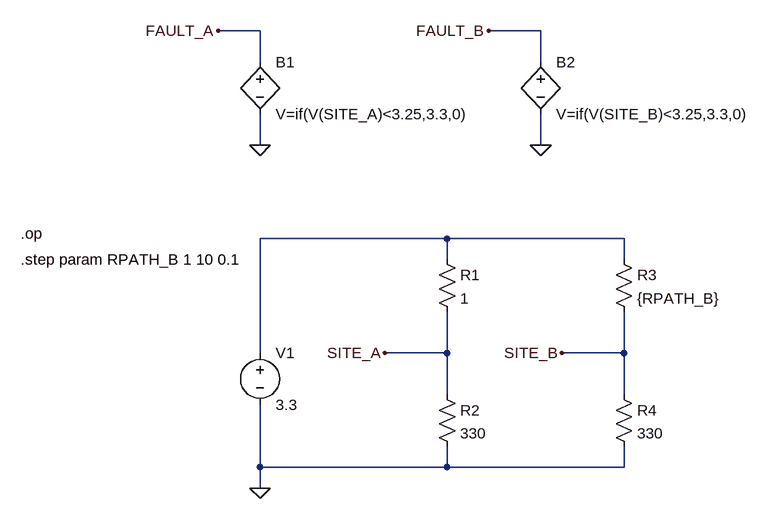
[diagram p0: schematic Mini_LoadBoard_Power_Test.asc]
Mini_LoadBoard_Power_Test.asc, the LTspice schematic file:
Version 4.1
SHEET 1 880 680
WIRE -128 -352 -192 -352
WIRE 304 -352 224 -352
WIRE -128 -304 -128 -352
WIRE 304 -304 304 -352
WIRE -128 -176 -128 -224
WIRE 304 -176 304 -224
WIRE 160 -32 -128 -32
WIRE 432 -32 160 -32
WIRE 160 0 160 -32
WIRE 432 0 432 -32
WIRE -128 144 -128 -32
WIRE 160 144 160 80
WIRE 160 144 64 144
WIRE 432 144 432 80
WIRE 432 144 336 144
WIRE 160 208 160 144
WIRE 432 208 432 144
WIRE -128 320 -128 224
WIRE 160 320 160 288
WIRE 160 320 -128 320
WIRE 432 320 432 288
WIRE 432 320 160 320
WIRE -128 352 -128 320
FLAG -128 352 0
FLAG 64 144 SITE_A
FLAG 336 144 SITE_B
FLAG -192 -352 FAULT_A
FLAG 224 -352 FAULT_B
FLAG -128 -176 0
FLAG 304 -176 0
SYMBOL voltage -128 128 R0
WINDOW 123 0 0 Left 0
WINDOW 39 0 0 Left 0
SYMATTR InstName V1
SYMATTR Value 3.3
SYMBOL res 144 -16 R0
SYMATTR InstName R1
SYMATTR Value 1
SYMBOL res 144 192 R0
SYMATTR InstName R2
SYMATTR Value 330
SYMBOL res 416 -16 R0
SYMATTR InstName R3
SYMATTR Value {RPATH_B}
SYMBOL res 416 192 R0
SYMATTR InstName R4
SYMATTR Value 330
SYMBOL bv -128 -320 R0
SYMATTR InstName B1
SYMATTR Value V=if(V(SITE_A)<3.25,3.3,0)
SYMBOL bv 304 -320 R0
SYMATTR InstName B2
SYMATTR Value V=if(V(SITE_B)<3.25,3.3,0)
TEXT -496 -40 Left 2 !.op
TEXT -496 0 Left 2 !.step param RPATH_B 1 10 0.1

The netlist it stands for:
* Mini_LoadBoard_Power_Test.asc
V1 N001 0 3.3
R1 N001 SITE_A 1
R2 SITE_A 0 330
R3 N001 SITE_B {RPATH_B}
R4 SITE_B 0 330
B1 FAULT_A 0 V=if(V(SITE_A)<3.25,3.3,0)
B2 FAULT_B 0 V=if(V(SITE_B)<3.25,3.3,0)
.op
.step param RPATH_B 1 10 0.1
.backanno
.end